# Altium schematic sheet IBM_PC_RAM.SchDoc
size A3; SheetNumber: 7; SheetTotal: 18
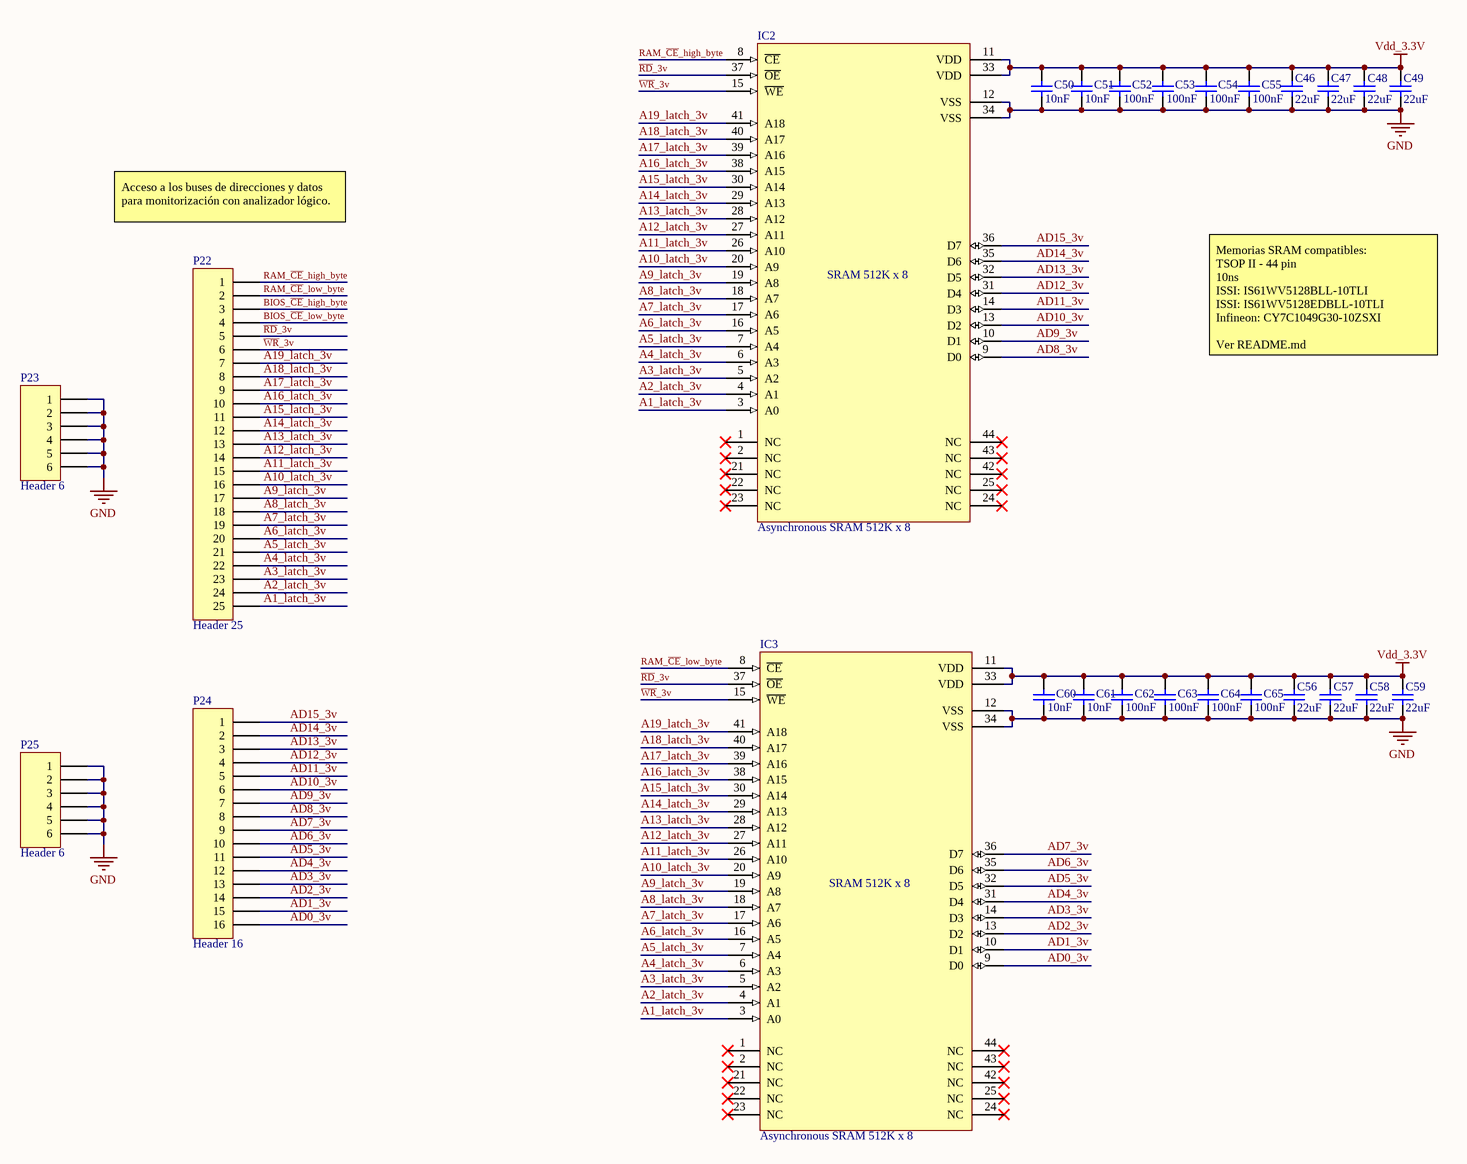
[diagram p0: IBM_PC_RAM.SchDoc]

## Parts
C46  value 22uF  [capacitor 0603]  (hidden comment: ceramic capacitor)
C47  value 22uF  [capacitor 0603]  (hidden comment: ceramic capacitor)
C48  value 22uF  [capacitor 0603]  (hidden comment: ceramic capacitor)
C49  value 22uF  [capacitor 0603]  (hidden comment: ceramic capacitor)
C50  value 10nF  [capacitor 0603]  (hidden comment: Ceramic capacitor)
C51  value 10nF  [capacitor 0603]  (hidden comment: Ceramic capacitor)
C52  value 100nF  [capacitor 0603]  (hidden comment: Ceramic capacitor)
C53  value 100nF  [capacitor 0603]  (hidden comment: Ceramic capacitor)
C54  value 100nF  [capacitor 0603]  (hidden comment: Ceramic capacitor)
C55  value 100nF  [capacitor 0603]  (hidden comment: Ceramic capacitor)
C56  value 22uF  [capacitor 0603]  (hidden comment: ceramic capacitor)
C57  value 22uF  [capacitor 0603]  (hidden comment: ceramic capacitor)
C58  value 22uF  [capacitor 0603]  (hidden comment: ceramic capacitor)
C59  value 22uF  [capacitor 0603]  (hidden comment: ceramic capacitor)
C60  value 10nF  [capacitor 0603]  (hidden comment: Ceramic capacitor)
C61  value 10nF  [capacitor 0603]  (hidden comment: Ceramic capacitor)
C62  value 100nF  [capacitor 0603]  (hidden comment: Ceramic capacitor)
C63  value 100nF  [capacitor 0603]  (hidden comment: Ceramic capacitor)
C64  value 100nF  [capacitor 0603]  (hidden comment: Ceramic capacitor)
C65  value 100nF  [capacitor 0603]  (hidden comment: Ceramic capacitor)
IC2  Asynchronous SRAM 512K x 8  [TSOP II - 44pin]
IC3  Asynchronous SRAM 512K x 8  [TSOP II - 44pin]
P22  Header 25  [HDR1X25]
P23  Header 6  [HDR1X6]
P24  Header 16  [HDR1X16]
P25  Header 6  [HDR1X6]

## Nets
GND: C46.1 C47.1 C48.1 C49.1 C50.1 C51.1 C52.1 C53.1 C54.1 C55.1 C56.1 C57.1 C58.1 C59.1 C60.1 C61.1 C62.1 C63.1 C64.1 C65.1 IC2.12(VSS) IC2.34(VSS) IC3.12(VSS) IC3.34(VSS) P23.1 P23.2 P23.3 P23.4 P23.5 P23.6 P25.1 P25.2 P25.3 P25.4 P25.5 P25.6
Vdd_3.3V: C46.2 C47.2 C48.2 C49.2 C50.2 C51.2 C52.2 C53.2 C54.2 C55.2 C56.2 C57.2 C58.2 C59.2 C60.2 C61.2 C62.2 C63.2 C64.2 C65.2 IC2.11(VDD) IC2.33(VDD) IC3.11(VDD) IC3.33(VDD)
A1_latch_3v: IC2.3(A0) IC3.3(A0) P22.25
A2_latch_3v: IC2.4(A1) IC3.4(A1) P22.24
A3_latch_3v: IC2.5(A2) IC3.5(A2) P22.23
A4_latch_3v: IC2.6(A3) IC3.6(A3) P22.22
A5_latch_3v: IC2.7(A4) IC3.7(A4) P22.21
A6_latch_3v: IC2.16(A5) IC3.16(A5) P22.20
A7_latch_3v: IC2.17(A6) IC3.17(A6) P22.19
A8_latch_3v: IC2.18(A7) IC3.18(A7) P22.18
A9_latch_3v: IC2.19(A8) IC3.19(A8) P22.17
A10_latch_3v: IC2.20(A9) IC3.20(A9) P22.16
A11_latch_3v: IC2.26(A10) IC3.26(A10) P22.15
A12_latch_3v: IC2.27(A11) IC3.27(A11) P22.14
A13_latch_3v: IC2.28(A12) IC3.28(A12) P22.13
A14_latch_3v: IC2.29(A13) IC3.29(A13) P22.12
A15_latch_3v: IC2.30(A14) IC3.30(A14) P22.11
A16_latch_3v: IC2.38(A15) IC3.38(A15) P22.10
A17_latch_3v: IC2.39(A16) IC3.39(A16) P22.9
A18_latch_3v: IC2.40(A17) IC3.40(A17) P22.8
A19_latch_3v: IC2.41(A18) IC3.41(A18) P22.7
AD0_3v: IC3.9(D0) P24.16
AD1_3v: IC3.10(D1) P24.15
AD2_3v: IC3.13(D2) P24.14
AD3_3v: IC3.14(D3) P24.13
AD4_3v: IC3.31(D4) P24.12
AD5_3v: IC3.32(D5) P24.11
AD6_3v: IC3.35(D6) P24.10
AD7_3v: IC3.36(D7) P24.9
AD8_3v: IC2.9(D0) P24.8
AD9_3v: IC2.10(D1) P24.7
AD10_3v: IC2.13(D2) P24.6
AD11_3v: IC2.14(D3) P24.5
AD12_3v: IC2.31(D4) P24.4
AD13_3v: IC2.32(D5) P24.3
AD14_3v: IC2.35(D6) P24.2
AD15_3v: IC2.36(D7) P24.1
BIOS_~{CE}_high_byte: P22.3
BIOS_~{CE}_low_byte: P22.4
~{RD}_3v: IC2.37(~{OE}) IC3.37(~{OE}) P22.5
RAM_~{CE}_high_byte: IC2.8(~{CE}) P22.1
RAM_~{CE}_low_byte: IC3.8(~{CE}) P22.2
~{WR}_3v: IC2.15(~{WE}) IC3.15(~{WE}) P22.6

Not connected (* = marked no-connect by the designer): IC2 1(NC)* 2(NC)* 21(NC)* 22(NC)* 23(NC)* 24(NC)* 25(NC)* 42(NC)* 43(NC)* 44(NC)*; IC3 1(NC)* 2(NC)* 21(NC)* 22(NC)* 23(NC)* 24(NC)* 25(NC)* 42(NC)* 43(NC)* 44(NC)*

## Notes on the sheet
- Acceso a los buses de direcciones y datos para monitorización con analizador lógico.
- Memorias SRAM compatibles:
  TSOP II - 44 pin
  10ns
  ISSI: IS61WV5128BLL-10TLI
  ISSI: IS61WV5128EDBLL-10TLI
  Infineon: CY7C1049G30-10ZSXI
  Ver README.md
- (in symbol Asynchronous SRAM 512K x 8) SRAM 512K x 8

## Library data of the parts
C46-C49 C56-C59 = ceramic capacitor: Multilayer ceramic capacitor; V: 6.3; LCSC part: C59461; Package: 0603
C50-C55 C60-C65 = Ceramic capacitor: Multilayer ceramic capacitor; V: 50; Package: 0603
  C50 C51 C60 C61: LCSC part: C1591
  C52-C55 C62-C65: LCSC part: C14663
IC2 IC3 = Asynchronous SRAM 512K x 8: MFR: ISSI; MFR part: IS61WV5128BLL-10TLI; Temp: −40 to +85 °C; Package: TSOP II - 44pin
P22 = Header 25: Header, 25-Pin; LatestRevisionDate: 17-Jul-2002; LatestRevisionNote: Re-released for DXP Platform.; Publisher: Altium Limited
P23 P25 = Header 6: Header, 6-Pin; LatestRevisionDate: 17-Jul-2002; LatestRevisionNote: Re-released for DXP Platform.; Publisher: Altium Limited
P24 = Header 16: Header, 16-Pin; LatestRevisionDate: 17-Jul-2002; LatestRevisionNote: Re-released for DXP Platform.; Publisher: Altium Limited